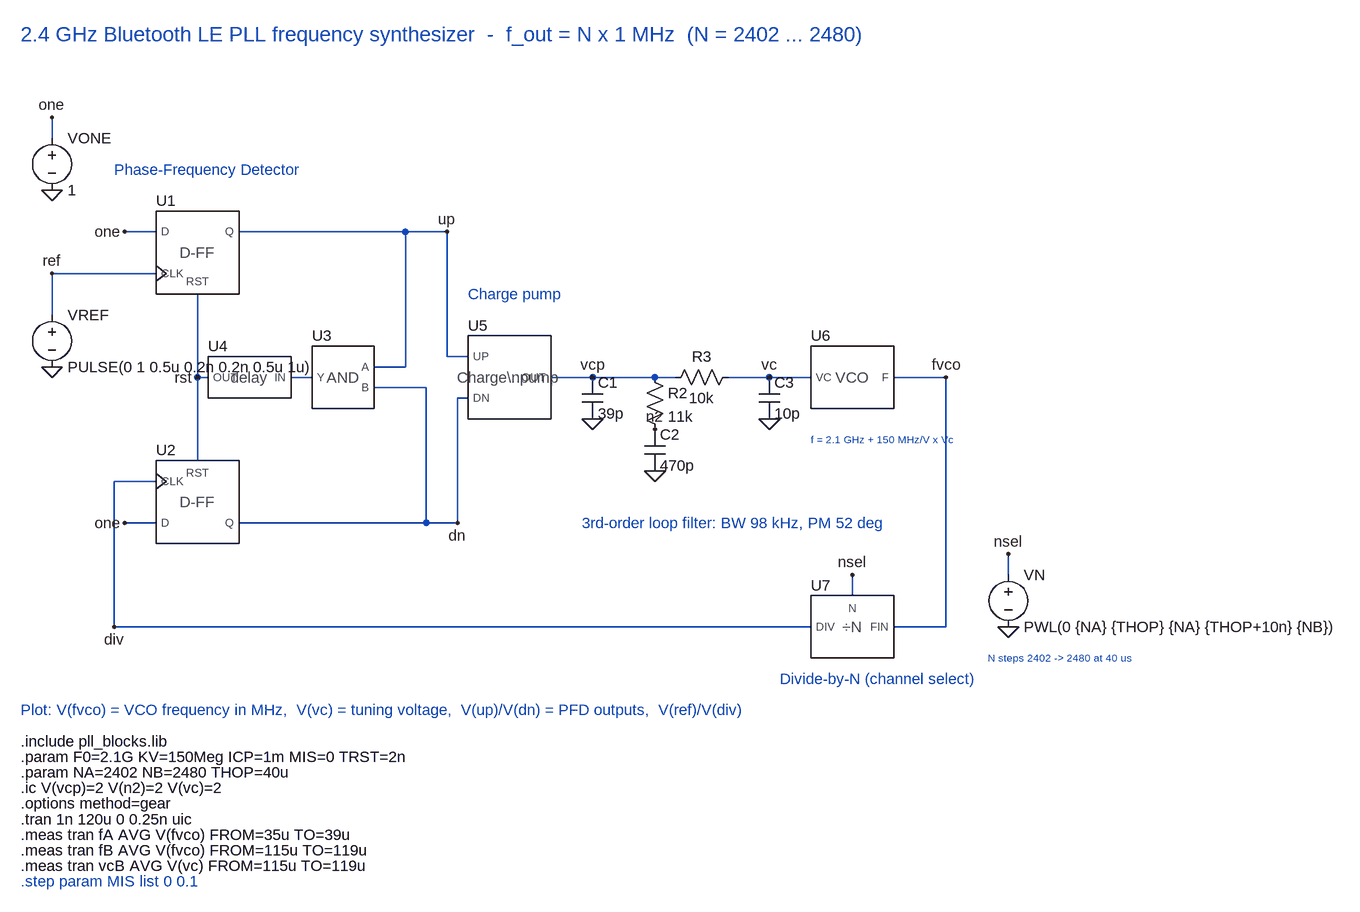
[diagram p0: schematic pll_synth.asc]
pll_synth.asc, the LTspice schematic file:
Version 4
SHEET 1 2000 1200
WIRE 64 80 64 48
WIRE 64 352 64 288
WIRE 64 288 224 288
WIRE 224 224 176 224
WIRE 224 672 176 672
WIRE 352 224 608 224
WIRE 608 224 672 224
WIRE 608 224 608 432
WIRE 608 432 560 432
WIRE 352 672 640 672
WIRE 640 672 688 672
WIRE 640 672 640 464
WIRE 640 464 560 464
WIRE 464 448 432 448
WIRE 304 448 288 448
WIRE 288 448 288 320
WIRE 288 448 288 576
WIRE 672 224 672 416
WIRE 672 416 704 416
WIRE 688 672 688 480
WIRE 688 480 704 480
WIRE 832 448 896 448
WIRE 896 448 992 448
WIRE 992 448 1024 448
WIRE 1104 448 1168 448
WIRE 1168 448 1232 448
WIRE 1360 448 1440 448
WIRE 1440 448 1440 832
WIRE 1440 832 1360 832
WIRE 1296 784 1296 752
WIRE 1536 752 1536 720
WIRE 1232 832 160 832
WIRE 160 832 160 608
WIRE 160 608 224 608
FLAG 64 48 one
FLAG 64 160 0
FLAG 64 432 0
FLAG 64 288 ref
FLAG 176 224 one
FLAG 176 672 one
FLAG 672 224 up
FLAG 688 672 dn
FLAG 288 448 rst
FLAG 896 512 0
FLAG 896 448 vcp
FLAG 992 592 0
FLAG 992 528 n2
FLAG 1168 512 0
FLAG 1168 448 vc
FLAG 1440 448 fvco
FLAG 1296 752 nsel
FLAG 1536 720 nsel
FLAG 1536 832 0
FLAG 160 832 div
SYMBOL voltage 64 64 R0
SYMATTR InstName VONE
SYMATTR Value 1
SYMBOL voltage 64 336 R0
SYMATTR InstName VREF
SYMATTR Value PULSE(0 1 0.5u 0.2n 0.2n 0.5u 1u)
SYMBOL pfd_dff 288 256 R0
SYMATTR InstName U1
SYMBOL pfd_dff_r 288 640 R0
SYMATTR InstName U2
SYMBOL and2_l 512 448 R0
SYMATTR InstName U3
SYMBOL delay_l 368 448 R0
SYMATTR InstName U4
SYMBOL chgpump 768 448 R0
SYMATTR InstName U5
SYMBOL cap 880 448 R0
SYMATTR InstName C1
SYMATTR Value 39p
SYMBOL res 976 432 R0
SYMATTR InstName R2
SYMATTR Value 11k
SYMBOL cap 976 528 R0
SYMATTR InstName C2
SYMATTR Value 470p
SYMBOL res 1120 432 R90
WINDOW 0 0 56 VBottom 2
WINDOW 3 32 56 VTop 2
SYMATTR InstName R3
SYMATTR Value 10k
SYMBOL cap 1152 448 R0
SYMATTR InstName C3
SYMATTR Value 10p
SYMBOL vco 1296 448 R0
SYMATTR InstName U6
SYMBOL divn 1296 832 R0
SYMATTR InstName U7
SYMBOL voltage 1536 736 R0
SYMATTR InstName VN
SYMATTR Value PWL(0 {NA} {THOP} {NA} {THOP+10n} {NB})
TEXT 16 -80 Left 3 ;2.4 GHz Bluetooth LE PLL frequency synthesizer  -  f_out = N x 1 MHz  (N = 2402 ... 2480)
TEXT 160 128 Left 2 ;Phase-Frequency Detector
TEXT 704 320 Left 2 ;Charge pump
TEXT 880 672 Left 2 ;3rd-order loop filter: BW 98 kHz, PM 52 deg
TEXT 1232 544 Left 1 ;f = 2.1 GHz + 150 MHz/V x Vc
TEXT 1184 912 Left 2 ;Divide-by-N (channel select)
TEXT 1504 880 Left 1 ;N steps 2402 -> 2480 at 40 us
TEXT 16 960 Left 2 ;Plot: V(fvco) = VCO frequency in MHz,  V(vc) = tuning voltage,  V(up)/V(dn) = PFD outputs,  V(ref)/V(div)
TEXT 16 1008 Left 2 !.include pll_blocks.lib
TEXT 16 1032 Left 2 !.param F0=2.1G KV=150Meg ICP=1m MIS=0 TRST=2n
TEXT 16 1056 Left 2 !.param NA=2402 NB=2480 THOP=40u
TEXT 16 1080 Left 2 !.ic V(vcp)=2 V(n2)=2 V(vc)=2
TEXT 16 1104 Left 2 !.options method=gear
TEXT 16 1128 Left 2 !.tran 1n 120u 0 0.25n uic
TEXT 16 1152 Left 2 !.meas tran fA AVG V(fvco) FROM=35u TO=39u
TEXT 16 1176 Left 2 !.meas tran fB AVG V(fvco) FROM=115u TO=119u
TEXT 16 1200 Left 2 !.meas tran vcB AVG V(vc) FROM=115u TO=119u
TEXT 16 1224 Left 2 ;.step param MIS list 0 0.1

The netlist it stands for:
* pll_synth.asc
VONE one 0 1
VREF ref 0 PULSE(0 1 0.5u 0.2n 0.2n 0.5u 1u)
XU1 one ref rst up DFF_PFD  ; pins D CLK RST Q
XU2 one div rst dn DFF_PFD  ; pins D CLK RST Q
XU3 up dn N001 AND2  ; pins A B Y
XU4 N001 rst DELAY  ; pins IN OUT
XU5 up dn vcp CHGPUMP  ; pins UP DN OUT
C1 vcp 0 39p
R2 vcp n2 11k
C2 n2 0 470p
R3 vc vcp 10k
C3 vc 0 10p
XU6 vc fvco VCO  ; pins VC F
XU7 fvco nsel div DIVN  ; pins FIN N DIV
VN nsel 0 PWL(0 {NA} {THOP} {NA} {THOP+10n} {NB})
* 2.4 GHz Bluetooth LE PLL frequency synthesizer  -  f_out = N x 1 MHz  (N = 2402 ... 2480)
* Phase-Frequency Detector
* Charge pump
* 3rd-order loop filter: BW 98 kHz, PM 52 deg
* f = 2.1 GHz + 150 MHz/V x Vc
* Divide-by-N (channel select)
* N steps 2402 -> 2480 at 40 us
* Plot: V(fvco) = VCO frequency in MHz,  V(vc) = tuning voltage,  V(up)/V(dn) = PFD outputs,  V(ref)/V(div)
.include pll_blocks.lib
.param F0=2.1G KV=150Meg ICP=1m MIS=0 TRST=2n
.param NA=2402 NB=2480 THOP=40u
.ic V(vcp)=2 V(n2)=2 V(vc)=2
.options method=gear
.tran 1n 120u 0 0.25n uic
.meas tran fA AVG V(fvco) FROM=35u TO=39u
.meas tran fB AVG V(fvco) FROM=115u TO=119u
.meas tran vcB AVG V(vc) FROM=115u TO=119u
* .step param MIS list 0 0.1
.backanno
.end